# Altium schematic sheet ADC.schdoc
size 297 x 209 mm; Symbol: Drawing-Symbol_A4; @Project Name: Pedal Steel; @Page Count: 1; @Update Date: 2026-10-20; @Create Date: 2026-10-20; @Schematic Name: Schematic1; @Page No: 1; @Page Name: P1; Company: EasyEDA.com; Version: V1.0; Page Size: A4; Device: Drawing-Symbol_A4; @Create Time: 16:29:24; @Update Time: 16:29:24; Border: 1; Width: 1170; Height: 825; Region Start: 1; X Region Count: 6; Y Region Count: 4; Blade Width: 10; Title Block Position: 3
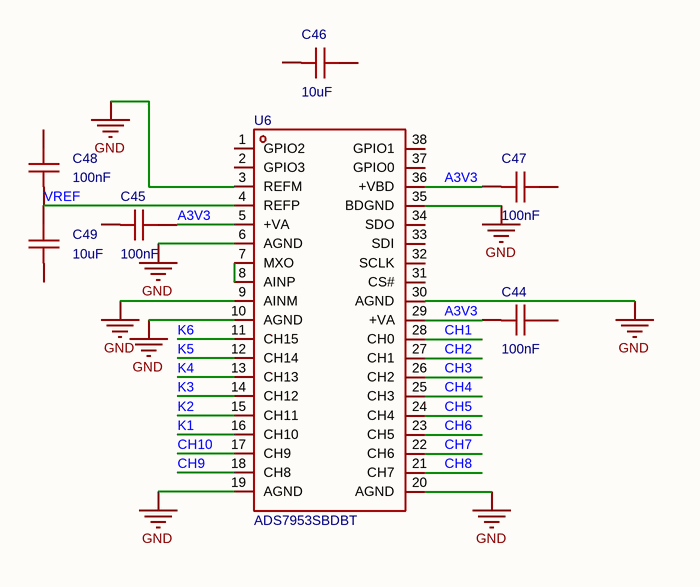
[diagram p0: ADC.schdoc]

## Parts
C44  100nF  [C0603]
C45  100nF  [C0603]
C46  10uF  [C0603]
C47  100nF  [C0603]
C48  100nF  [C0603]
C49  10uF  [C0603]
U6  ADS7953SBDBT  [TSSOP-38_L9.7-W4.4-P0.50-LS6.4-BL]

## Nets
GND: U6.3(REFM) U6.6(AGND) U6.9(AINM) U6.10(AGND) U6.19(AGND) U6.20(AGND) U6.30(AGND) U6.35(BDGND)
A3V3: C44.2 C45.1 C47.2 U6.5(+VA) U6.29(+VA) U6.36(+VBD)
CH1: U6.28(CH0)
CH2: U6.27(CH1)
CH3: U6.26(CH2)
CH4: U6.25(CH3)
CH5: U6.24(CH4)
CH6: U6.23(CH5)
CH7: U6.22(CH6)
CH8: U6.21(CH7)
CH9: U6.18(CH8)
CH10: U6.17(CH9)
K1: U6.16(CH10)
K2: U6.15(CH11)
K3: U6.14(CH12)
K4: U6.13(CH13)
K5: U6.12(CH14)
K6: U6.11(CH15)
VREF: C48.2 C49.1 U6.4(REFP)
NetU6_7: U6.7(MXO) U6.8(AINP)

Not connected (* = marked no-connect by the designer): C44 1; C45 2; C46 1 2; C47 1; C48 1; C49 2; U6 1(GPIO2) 2(GPIO3) 31(CS#) 32(SCLK) 33(SDI) 34(SDO) 37(GPIO0) 38(GPIO1)

## Notes on the sheet
- Create at
- 2026-10-20
- Schematic
- Board
- Schematic1
- Update at
- Page
- P1
- Drawn
- Reviewed
- Pedal Steel
- Version
- V1.0
- Size
- A4
- Page  1  Total  1
- EasyEDA.com

## Library data of the parts
C44-C49 = CAP_0603: Symbol: CAP_OLD; ConvertToPcb: yes; ModelId: 624118aa3cc7497086c383c2d72e08520819f05c4eef4c71ace90d822a990e87; ModelName: C0603_L1.6-W0.8-H0.8; ModelTransform: 62.992,31.496,0,0,0,0,0,0,0; Device: CAP_0603; AddInBom: yes; Supplier Footprint: 0603; FootprintName: C0603
  C44 C45 C47 C48: Value: 100nF
  C46 C49: Value: 10uF
U6 = ADS7953SBDBT: Resolution (Bits):12 Sampling Rate:1MHz number of channels:16 Voltage - Supply:2.7V~5.25V Voltage - Supply:2.7V~5.25V Interface:Serial port differential input:No Integral non - linearity:0.5LSB Integral non - linearity:0.5LSB Operating Temperature:-40℃~+1; Manufacturer: TI(德州仪器); AddInBom: yes; ModelId: 4c1db536ed5641bf81ee274c95a6a2500819f05c4eef4c71ace90d822a990e87; ModelName: TSSOP-38_L9.7-W4.4-H1.0-LS6.4-P0.50; ModelTransform: 381.889,251.968,0,0,0,0,0,0,0; Resolution (Bits): 12; Sampling Rate: 1MHz; number of channels: 16; differential input: No; Integral non - linearity: 0.5LSB; Signal-to-Noise Ratio: 71.7dB; Clock Frequency: 20MHz; ADC architecture: SAR; Quiescent Current (Iq): 3mA; Symbol: ADS7953SBDBT; Device: ADS7953SBDBT; LCSC Part Name: 兼容引脚型12/10/8位、1MSPS、16/12/8/4通道、单端、串行接口ADC; SupplierPart: C701092; ManufacturerPart: ADS7953SBDBT; Supplier Footprint: TSSOP-38-4.4mm; JLCPCB Part Class: Extended Part; Datasheet: https://www.ti.com/cn/lit/ds/symlink/ads7955.pdf; Supplier: LCSC; ConvertToPcb: yes; FootprintName: TSSOP-38_L9.7-W4.4-P0.50-LS6.4-BL; Voltage - Supply: 2.7V~5.25V; Interface: Serial port; Operating Temperature: -40℃~+125℃; Features: Multiplexers